# Altium schematic sheet LED_Square.SchDoc
size A4
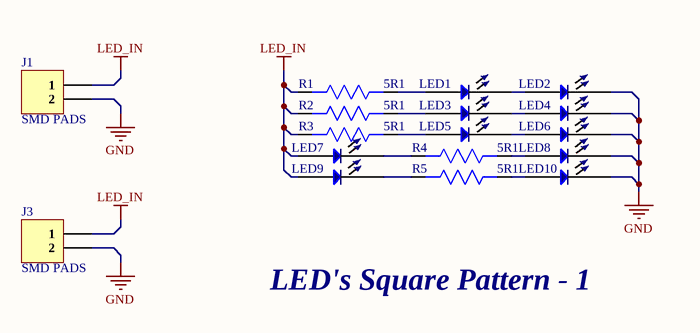
[diagram p0: LED_Square.SchDoc]

## Parts
J1  SMD PADS  [SMD PAD]
J3  SMD PADS  [SMD PAD]
LED1  White LED  [White LED]  (value not drawn)
LED2  White LED  [White LED]  (value not drawn)
LED3  White LED  [White LED]  (value not drawn)
LED4  White LED  [White LED]  (value not drawn)
LED5  White LED  [White LED]  (value not drawn)
LED6  White LED  [White LED]  (value not drawn)
LED7  White LED  [White LED]  (value not drawn)
LED8  White LED  [White LED]  (value not drawn)
LED9  White LED  [White LED]  (value not drawn)
LED10  White LED  [White LED]  (value not drawn)
R1  5R1  [Res1206]
R2  5R1  [Res1206]
R3  5R1  [Res1206]
R4  5R1  [Res1206]
R5  5R1  [Res1206]

## Nets
GND: J1.2 J3.2 LED2.1(K) LED4.1(K) LED6.1(K) LED8.1(K) LED10.1(K)
LED_IN: J1.1 J3.1 LED7.2(A) LED9.2(A) R1.2 R2.2 R3.2
NetLED1_1: LED1.1(K) LED2.2(A)
NetLED1_2: LED1.2(A) R1.1
NetLED3_1: LED3.1(K) LED4.2(A)
NetLED3_2: LED3.2(A) R2.1
NetLED5_1: LED5.1(K) LED6.2(A)
NetLED5_2: LED5.2(A) R3.1
NetLED7_1: LED7.1(K) R4.2
NetLED8_2: LED8.2(A) R4.1
NetLED9_1: LED9.1(K) R5.2
NetLED10_2: LED10.2(A) R5.1

## Notes on the sheet
- LED's Square Pattern - 1

## Library data of the parts
J1 J3 = SMD PAD
LED1-LED10 = HL-AM-2835H421W-S1-08-HR6(SDCM<6)(2800K-3100K)60mA: White 2800K~3100K 2.8V~3.4V SMD,3.5x2.8x0.7mm Light Emitting Diodes (LED) RoHS; Manufacturer: HONGLITRONIC(Hongli Zhihui (HONGLITRONIC)); Value: Custom; Manufacturer Part No: HL-AM-2835H421W-S1-08-HR6(SDCM<6)(2800K-3100K)60mA; Package: Custom; ComponentLink1Description: Supplier Link; ComponentLink1URL: https://lcsc.com/product-detail/Light-Emitting-Diodes-LED_HONGLITRONIC-Hongli-Zhihui-HONGLITRONIC-HL-AM-2835H421W-S1-08-HR6-SDCM-6-2800K-3100K-60mA_C516131.html
R1-R5 = 1206W4J051JT5E: RES SMD 5.1Ω ±5% 0.25W 1206; Manufacturer: UNI-ROYAL(Uniroyal Elec); Temperature Coefficient: ±400ppm/℃; Package: 1206; Resistance: 5.1Ω; Tolerance: ±5%; Power(Watts): 0.25W